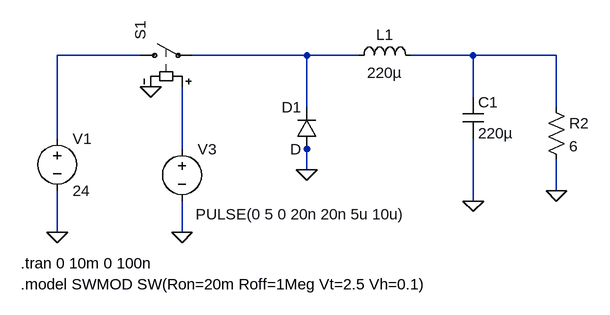
[diagram p0: schematic Industry_based_buck_converter.asc]
Industry_based_buck_converter.asc, the LTspice schematic file:
Version 4.1
SHEET 1 1156 772
WIRE 48 336 -80 336
WIRE 304 336 128 336
WIRE 384 336 304 336
WIRE 560 336 464 336
WIRE 688 336 560 336
WIRE 560 400 560 336
WIRE 304 416 304 336
WIRE 688 416 688 336
WIRE -80 464 -80 336
WIRE 112 480 112 384
WIRE 304 480 304 464
WIRE 304 512 304 480
WIRE 688 544 688 496
WIRE 560 560 560 464
WIRE -80 608 -80 544
WIRE 112 608 112 560
FLAG -80 608 0
FLAG 560 560 0
FLAG 64 384 0
FLAG 112 608 0
FLAG 688 544 0
FLAG 304 512 0
SYMBOL voltage -80 448 R0
WINDOW 123 0 0 Left 0
WINDOW 39 0 0 Left 0
SYMATTR InstName V1
SYMATTR Value 24
SYMBOL cap 544 400 R0
SYMATTR InstName C1
SYMATTR Value 220µ
SYMBOL ind 368 352 R270
WINDOW 0 32 56 VTop 2
WINDOW 3 5 56 VBottom 2
SYMATTR InstName L1
SYMATTR Value 220µ
SYMATTR SpiceLine Rser=1m
SYMBOL diode 320 480 R180
WINDOW 0 24 64 Left 2
WINDOW 3 24 0 Left 2
SYMATTR InstName D1
SYMBOL sw 32 336 R270
WINDOW 3 24 96 Invisible 2
SYMATTR InstName S1
SYMATTR Value SWMOD
SYMBOL voltage 112 464 R0
WINDOW 3 21 116 Left 2
WINDOW 123 0 0 Left 0
WINDOW 39 0 0 Left 0
SYMATTR InstName V3
SYMATTR Value PULSE(0 5 0 20n 20n 5u 10u)
SYMBOL res 672 400 R0
SYMATTR InstName R2
SYMATTR Value 6
TEXT -136 656 Left 2 !.tran 0 10m 0 100n
TEXT -136 688 Left 2 !.model SWMOD SW(Ron=20m Roff=1Meg Vt=2.5 Vh=0.1)

The netlist it stands for:
* Industry_based_buck_converter.asc
V1 N001 0 24
C1 N003 0 220µ
L1 N002 N003 220µ Rser=1m
D1 0 N002 D
S1 N001 N002 N004 0 SWMOD
V3 N004 0 PULSE(0 5 0 20n 20n 5u 10u)
R2 N003 0 6
.model D D
.lib standard.dio
.tran 0 10m 0 100n
.model SWMOD SW(Ron=20m Roff=1Meg Vt=2.5 Vh=0.1)
.backanno
.end